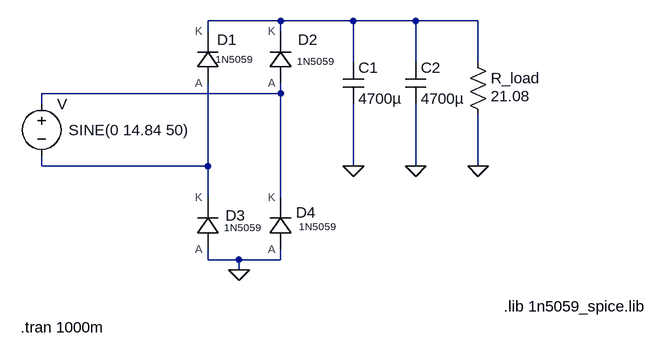
[diagram p0: schematic Sim.asc]
Sim.asc, the LTspice schematic file:
Version 4.1
SHEET 1 3352 1104
WIRE 1264 -80 1152 -80
WIRE 1376 -80 1264 -80
WIRE 1472 -80 1376 -80
WIRE 1568 -80 1472 -80
WIRE 1152 -64 1152 -80
WIRE 1264 -64 1264 -80
WIRE 1376 -16 1376 -80
WIRE 1472 -16 1472 -80
WIRE 1568 -16 1568 -80
WIRE 1264 32 1264 16
WIRE 1264 32 896 32
WIRE 896 48 896 32
WIRE 896 144 896 128
WIRE 1152 144 1152 16
WIRE 1152 144 896 144
WIRE 1376 144 1376 48
WIRE 1472 144 1472 48
WIRE 1568 144 1568 64
WIRE 1152 192 1152 144
WIRE 1264 192 1264 32
WIRE 1152 288 1152 272
WIRE 1200 288 1152 288
WIRE 1264 288 1264 272
WIRE 1264 288 1200 288
WIRE 1200 304 1200 288
FLAG 1568 144 0
FLAG 1200 304 0
FLAG 1376 144 0
FLAG 1472 144 0
SYMBOL res 1552 -32 R0
WINDOW 3 36 68 Left 2
SYMATTR Value 21.08
SYMATTR InstName R_load
SYMBOL voltage 896 32 R0
WINDOW 123 0 0 Left 0
WINDOW 39 0 0 Left 0
WINDOW 3 42 56 Left 2
SYMATTR Value SINE(0 14.84 50)
SYMATTR InstName V
SYMBOL cap 1360 -16 R0
SYMATTR InstName C1
SYMATTR Value 4700µ
SYMBOL cap 1456 -16 R0
SYMATTR InstName C2
SYMATTR Value 4700µ
SYMBOL 1n5059 1152 -16 R0
WINDOW 0 14 -35 Left 2
WINDOW 3 12 -5 Left 1
WINDOW 39 48 32 Invisible 2
SYMATTR InstName D1
SYMBOL 1n5059 1264 -16 R0
WINDOW 0 27 -35 Left 2
WINDOW 3 25 -2 Left 1
WINDOW 39 48 32 Invisible 2
SYMATTR InstName D2
SYMBOL 1n5059 1152 240 R0
WINDOW 0 27 -20 Left 2
WINDOW 3 25 -2 Left 1
WINDOW 39 48 32 Invisible 2
SYMATTR InstName D3
SYMBOL 1n5059 1264 240 R0
WINDOW 0 24 -25 Left 2
WINDOW 3 28 -3 Left 1
WINDOW 39 48 32 Invisible 2
SYMATTR InstName D4
TEXT 864 392 Left 2 !.tran 1000m
TEXT 1608 360 Left 2 !.lib 1n5059_spice.lib

The netlist it stands for:
* Sim.asc
R_load N001 0 21.08
V N002 N003 SINE(0 14.84 50)
C1 N001 0 4700µ
C2 N001 0 4700µ
X§D1 N003 N001 1N5059 Vrrm=200 Vrsm=200 Ir=5u Irsm=5u Vf=1.1 Ifav=2 Rs=.025 trr=1500n Cj=15p Eg=1.11 Xti=3  ; pins A K
X§D2 N002 N001 1N5059 Vrrm=200 Vrsm=200 Ir=5u Irsm=5u Vf=1.1 Ifav=2 Rs=.025 trr=1500n Cj=15p Eg=1.11 Xti=3  ; pins A K
X§D3 0 N003 1N5059 Vrrm=200 Vrsm=200 Ir=5u Irsm=5u Vf=1.1 Ifav=2 Rs=.025 trr=1500n Cj=15p Eg=1.11 Xti=3  ; pins A K
X§D4 0 N002 1N5059 Vrrm=200 Vrsm=200 Ir=5u Irsm=5u Vf=1.1 Ifav=2 Rs=.025 trr=1500n Cj=15p Eg=1.11 Xti=3  ; pins A K
.tran 1000m
.lib 1n5059_spice.lib
.lib .\1n5059_spice.lib
.backanno
.end